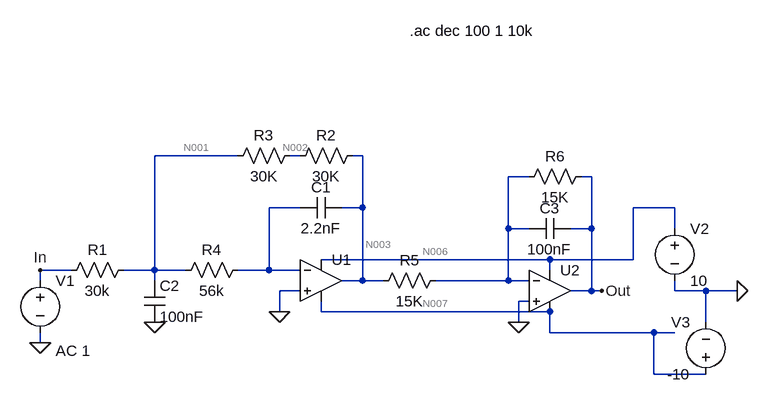
[diagram p0: schematic Draft1.asc]
Draft1.asc, the LTspice schematic file:
Version 4.1
SHEET 1 880 680
WIRE 32 -16 -96 -16
WIRE 128 -16 112 -16
WIRE 224 -16 208 -16
WIRE 480 16 448 16
WIRE 576 16 560 16
WIRE 128 64 80 64
WIRE 224 64 224 -16
WIRE 224 64 192 64
WIRE 704 64 640 64
WIRE 448 96 448 16
WIRE 480 96 448 96
WIRE 576 96 576 16
WIRE 576 96 544 96
WIRE 704 96 704 64
WIRE 512 144 160 144
WIRE 640 144 640 64
WIRE 640 144 512 144
WIRE -224 160 -272 160
WIRE -96 160 -96 -16
WIRE -96 160 -144 160
WIRE -48 160 -96 160
WIRE 80 160 80 64
WIRE 80 160 32 160
WIRE 128 160 80 160
WIRE 512 160 512 144
WIRE -272 176 -272 160
WIRE -96 176 -96 160
WIRE 224 176 224 64
WIRE 224 176 192 176
WIRE 256 176 224 176
WIRE 448 176 448 96
WIRE 448 176 336 176
WIRE 480 176 448 176
WIRE 128 192 96 192
WIRE 576 192 576 96
WIRE 576 192 544 192
WIRE 592 192 576 192
WIRE 704 192 704 176
WIRE 752 192 704 192
WIRE 800 192 752 192
WIRE 480 208 464 208
WIRE 96 224 96 192
WIRE 160 224 160 208
WIRE 512 224 160 224
WIRE 464 240 464 208
WIRE 752 240 752 192
WIRE 512 256 512 224
WIRE 672 256 512 256
WIRE 704 256 672 256
WIRE -272 272 -272 256
WIRE 672 320 672 256
WIRE 752 320 672 320
FLAG 96 224 0
FLAG -272 272 0
FLAG 592 192 Out
FLAG -272 160 In
FLAG -96 240 0
FLAG 464 240 0
FLAG 800 192 0
SYMBOL OpAmps\\UniversalOpAmp 160 176 R0
SYMATTR InstName U1
SYMBOL OpAmps\\UniversalOpAmp 512 192 R0
SYMATTR InstName U2
SYMBOL res -128 144 R90
WINDOW 0 0 56 VBottom 2
WINDOW 3 32 56 VTop 2
SYMATTR InstName R1
SYMATTR Value 30k
SYMBOL res 224 -32 R90
WINDOW 0 0 56 VBottom 2
WINDOW 3 32 56 VTop 2
SYMATTR InstName R2
SYMATTR Value 30K
SYMBOL res 128 -32 R90
WINDOW 0 0 56 VBottom 2
WINDOW 3 32 56 VTop 2
SYMATTR InstName R3
SYMATTR Value 30K
SYMBOL cap 192 48 R90
WINDOW 0 0 32 VBottom 2
WINDOW 3 32 32 VTop 2
SYMATTR InstName C1
SYMATTR Value 2.2nF
SYMBOL res 48 144 R90
WINDOW 0 0 56 VBottom 2
WINDOW 3 32 56 VTop 2
SYMATTR InstName R4
SYMATTR Value 56k
SYMBOL cap -112 176 R0
SYMATTR InstName C2
SYMATTR Value 100nF
SYMBOL res 352 160 R90
WINDOW 0 0 56 VBottom 2
WINDOW 3 32 56 VTop 2
SYMATTR InstName R5
SYMATTR Value 15K
SYMBOL res 576 0 R90
WINDOW 0 0 56 VBottom 2
WINDOW 3 32 56 VTop 2
SYMATTR InstName R6
SYMATTR Value 15K
SYMBOL cap 544 80 R90
WINDOW 0 0 32 VBottom 2
WINDOW 3 32 32 VTop 2
SYMATTR InstName C3
SYMATTR Value 100nF
SYMBOL voltage -272 160 R0
WINDOW 123 24 124 Left 2
WINDOW 39 0 0 Left 0
SYMATTR InstName V1
SYMATTR Value ""
SYMATTR Value2 AC 1
SYMBOL voltage 704 80 R0
WINDOW 123 0 0 Left 0
WINDOW 39 0 0 Left 0
SYMATTR InstName V2
SYMATTR Value 10
SYMBOL voltage 752 336 R180
WINDOW 0 24 96 Left 2
WINDOW 3 24 16 Left 2
WINDOW 123 0 0 Left 0
WINDOW 39 0 0 Left 0
SYMATTR InstName V3
SYMATTR Value -10
TEXT 296 -208 Left 2 !.ac dec 100 1 10k

The netlist it stands for:
* Draft1.asc
X§U1 0 N005 N006 N007 N003 level1 Avol=1Meg GBW=10Meg Vos=0 En=0 Enk=0 In=0 Ink=0 Rin=500Meg  ; pins In+ In- V+ V- OUT
X§U2 0 N004 N006 N007 Out level1 Avol=1Meg GBW=10Meg Vos=0 En=0 Enk=0 In=0 Ink=0 Rin=500Meg  ; pins In+ In- V+ V- OUT
R1 N001 In 30k
R2 N003 N002 30K
R3 N002 N001 30K
C1 N003 N005 2.2nF
R4 N005 N001 56k
C2 N001 0 100nF
R5 N004 N003 15K
R6 Out N004 15K
C3 Out N004 100nF
V1 In 0 AC 1
V2 N006 0 10
V3 N007 0 -10
.ac dec 100 1 10k
.lib UniversalOpAmp1.lib
.backanno
.end

* Results of the author's LTspice run, read from the files saved beside the schematic
* Operating Point, zero values left out:
*   V(n006) = 10 V
*   V(n007) = -10 V
*   I(V2) = -40 nA
*   I(V3) = 40 nA
*   Ix(u1:3) = 20 nA
*   Ix(u1:4) = -20 nA
*   Ix(u2:3) = 20 nA
*   Ix(u2:4) = -20 nA
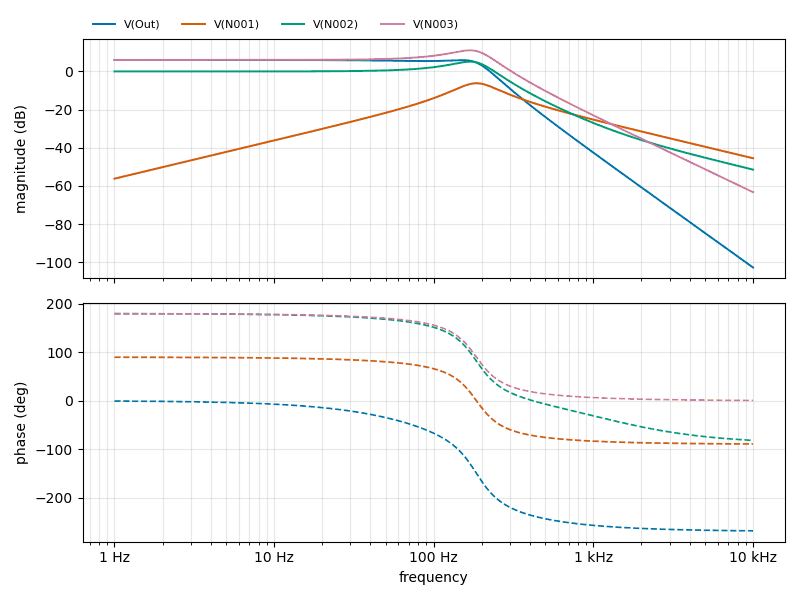
[diagram p1: AC Analysis of Draft1.asc, plotted from the saved traces]
* AC Analysis, 1 run:
*   V(Out): 6.02 dB at 1 Hz, -102.77 dB at 10 kHz, peak 6.02 dB at 1 Hz, 3 dB below the peak at 201.2 Hz
*   V(N001): -56.20 dB at 1 Hz, -45.50 dB at 10 kHz, peak -6.18 dB at 186.2 Hz, 3 dB below the peak at 138.8 Hz and 246.8 Hz
*   V(N002): 0.00 dB at 1 Hz, -51.45 dB at 10 kHz, peak 5.14 dB at 169.8 Hz, 3 dB below the peak at 97.58 Hz and 218.6 Hz
*   V(N003): 6.02 dB at 1 Hz, -63.28 dB at 10 kHz, peak 11.09 dB at 169.8 Hz, 3 dB below the peak at 96.44 Hz and 218.1 Hz